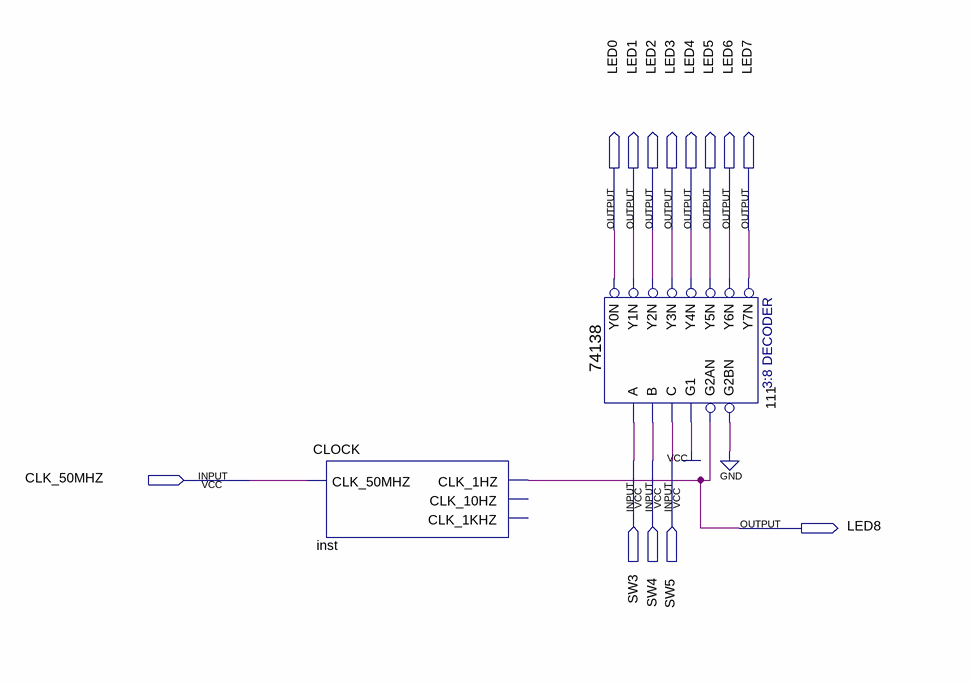
[diagram p0: schematic sheet]
// Quartus schematic SY_2.bdf as structural Verilog: 2 symbols, 13 pins
module SY_2 (
  input  SW3,
  input  SW4,
  input  SW5,
  input  CLK_50MHZ,
  output LED0,
  output LED1,
  output LED2,
  output LED3,
  output LED4,
  output LED5,
  output LED6,
  output LED7,
  output LED8
);

  CLOCK inst (.CLK_50MHZ(CLK_50MHZ), .CLK_1HZ(LED8));  // open: CLK_10HZ, CLK_1KHZ
  \74138  u_111 (
    .A(SW3), .B(SW4), .G1(1'b1), .C(SW5), .G2AN(LED8), .G2BN(1'b0), .Y0N(LED0), .Y1N(LED1), .Y2N(LED2),
    .Y3N(LED3), .Y4N(LED4), .Y5N(LED5), .Y6N(LED6), .Y7N(LED7));
endmodule
